# Altium schematic sheet Sheet1.SchDoc (part 3 of 3)
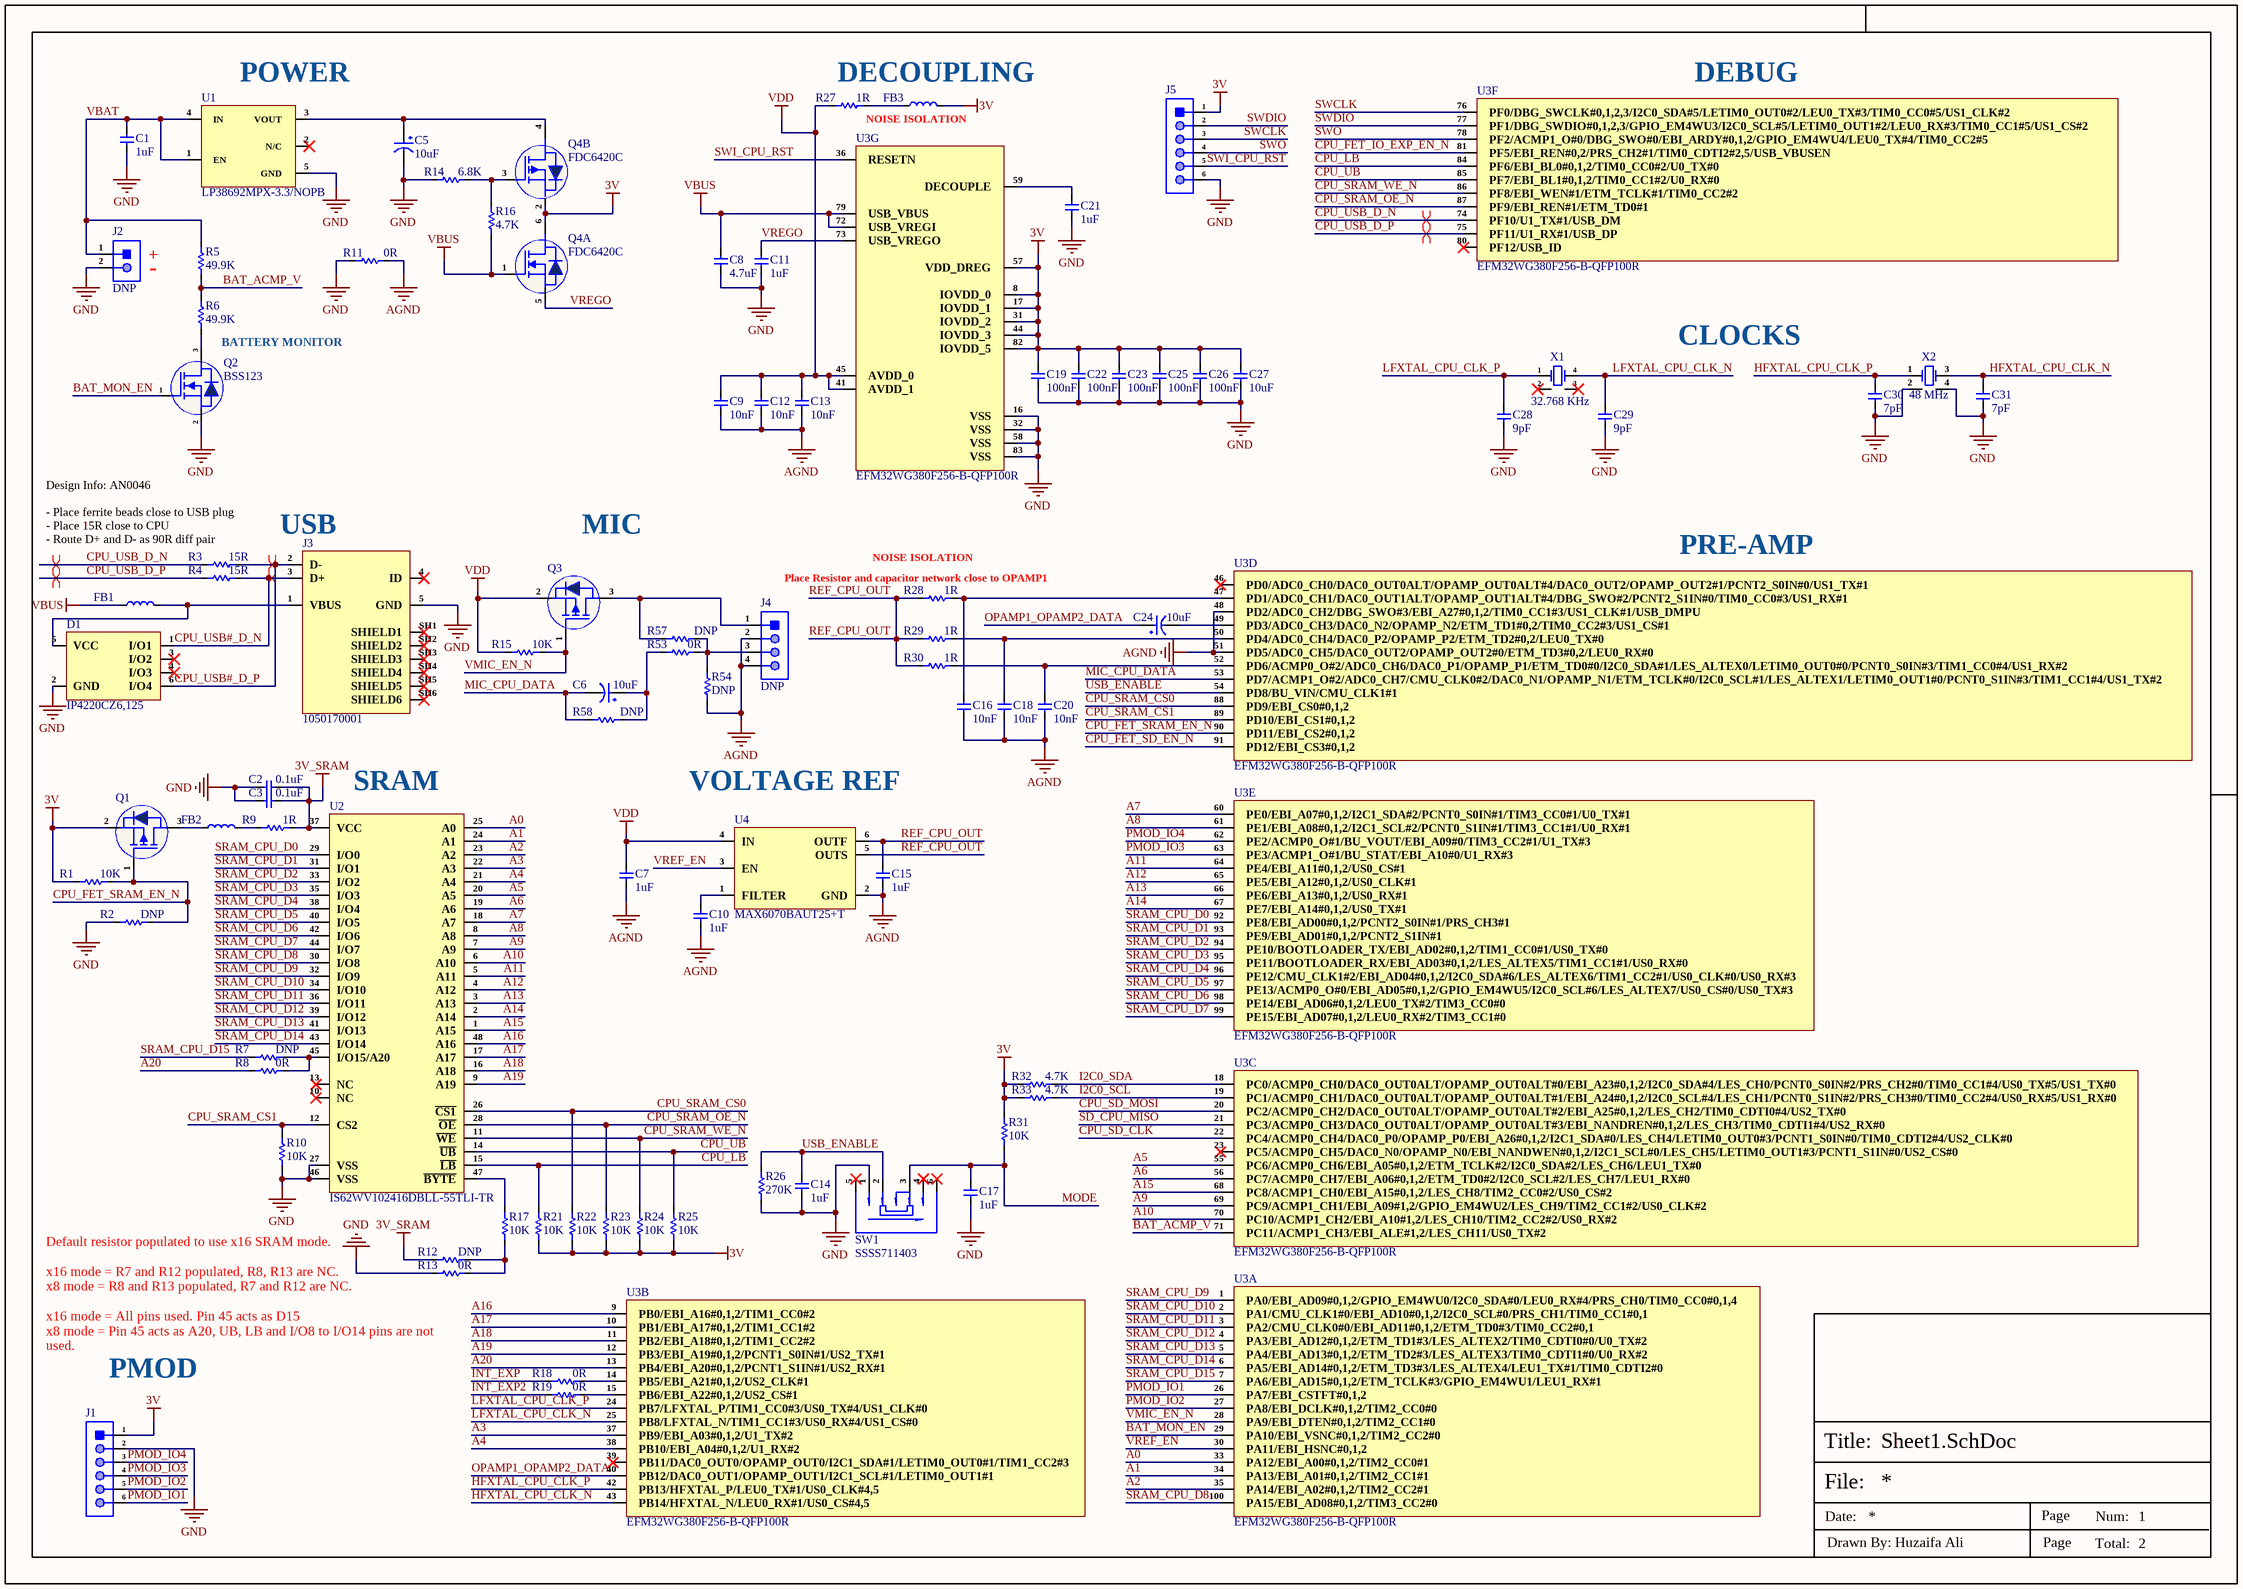
[diagram p2: Sheet1.SchDoc]

## Library data of the parts (continued)
U3 = EFM32WG380F256-B-QFP100R: IC MCU 32BIT 256KB FLASH 100LQFP; Manufacturer: Silicon Labs; Supplier: Mouser; Supplier Part Number: 634-WG380256BQFP100R; Manufacturer Part Number: EFM32WG380F256-B-QFP100R; Item Type: IC; Stock: 2000; Pricing: 1=13.12, 10=12.06, 50=11.56, 100=10.18, 1000=8.31, 10000=8.31 (USD)
U4 = MAX6070BAUT25+T: IC VREF SERIES 0.08% SOT23-6; Manufacturer: Analog Devices; Output Type: 6317OutputType; Reference Type: 6142ReferenceType; Max Supply Voltage: 5.5V; Max Output current: 10mA; Min Input Voltage: 2.7V; Min Output Voltage: 2.5V; Number of Channels: 1NUMBER; Operating Supply Current: 300uA; Quiescent Current: 235uA; Supplier: Mouser; LCSC Part Number: C143531; Manufacturer Part Number: MAX6070BAUT25+T; RoHS: No; Item Type: IC; Stock: 5392; Pricing: 1=3.56, 10=2.63, 50=2.63, 100=2.19, 1000=1.72, 10000=1.53 (USD); Mounting Technology: 8Mount; Case/Package: 942Case; Pins: 6NUMBER; Min Operating Temperature: -40°C; Max Operating Temperature: 125°C; Tolerance: 0.08%; Output Current: 10mA; Output Voltage: 2.5V; Radiation Hardening: 5898YesNo; ComponentLink1URL: https://datasheet.octopart.com/MAX6070BAUT25%2BT-Analog-Devices-datasheet-134530559.pdf?src-supplier=LKR; ComponentLink1Description: https://datasheet.octopart.com/MAX6070BAUT25%2BT-Analog-Devices-datasheet-134530559.pdf?src-supplier=LKR
X1 = Q13MC14620001: 32.768kHz 7pF ±20ppm MC-146 Crystals ROHS; Manufacturer: Seiko Epson; Manufacturer Part Number: Q13MC14620001; Package: MC-146; LCSC Part Number: C3013800; Item Type: Crystals; ComponentLink1Description: LCSC; ComponentLink1URL: https://www.lcsc.com/product-detail/Crystals_Seiko-span-style-background-color-ff0-Epson-span-Q13MC14620001_C3013800.html
X2 = XRCGB48M000F4M00R0: CRYSTAL 48.0000MHZ 6PF SMD; Manufacturer: Murata; Item Type: Crystals; Supplier: Mouser; LCSC Part Number: C1986590; Manufacturer Part Number: XRCGB48M000F4M00R0; RoHS: Yes; Stock: 4711; Pricing: 1=0.3, 10=0.231, 50=0.231, 100=0.211, 1000=0.179, 10000=0.128 (USD); ComponentLink1URL: https://datasheet.ciiva.com/3852/part29-3852564.pdf?src-supplier=Arrow+Electronics; ComponentLink1Description: https://datasheet.ciiva.com/3852/part29-3852564.pdf?src-supplier=Arrow+Electronics; ComponentLink2URL: https://datasheet.ciiva.com/852/p79e-852304.pdf?src-supplier=Digikey; ComponentLink2Description: https://datasheet.ciiva.com/852/p79e-852304.pdf?src-supplier=Digikey; ComponentLink3URL: https://datasheet.ciiva.com/852/p79e-852305.pdf?src-supplier=Digikey; ComponentLink3Description: https://datasheet.ciiva.com/852/p79e-852305.pdf?src-supplier=Digikey; ComponentLink4URL: https://datasheet.ciiva.com/852/p79e-852306.pdf?src-supplier=Digikey; ComponentLink4Description: https://datasheet.ciiva.com/852/p79e-852306.pdf?src-supplier=Digikey; ComponentLink5URL: https://datasheet.ciiva.com/1369/l0445e-1369913.pdf?src-supplier=Farnell; ComponentLink5Description: https://datasheet.ciiva.com/1369/l0445e-1369913.pdf?src-supplier=Farnell; ComponentLink6URL: https://datasheet.ciiva.com/1361/p79e-1361575.pdf?src-supplier=Element14; ComponentLink6Description: https://datasheet.ciiva.com/1361/p79e-1361575.pdf?src-supplier=Element14